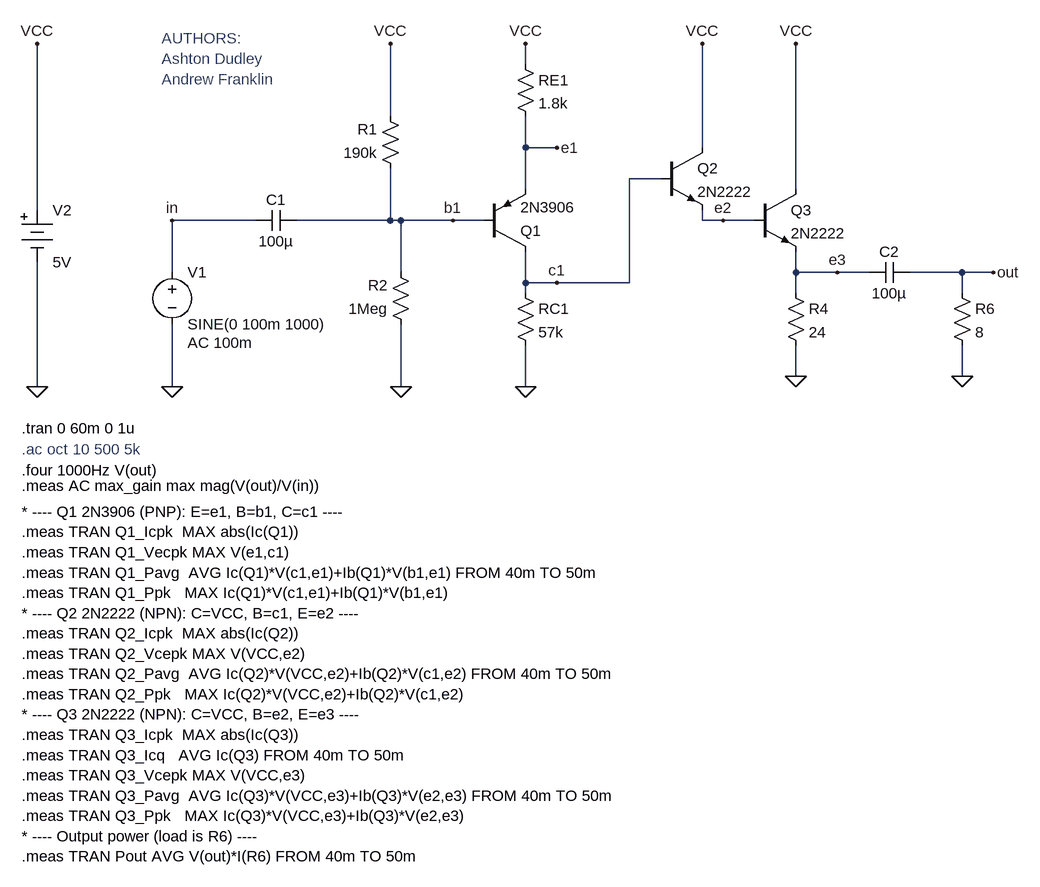
[diagram p0: schematic T5-03 - Lab 5 Amplifer V1.asc]
T5-03 - Lab 5 Amplifer V1.asc, the LTspice schematic file:
Version 4
SHEET 1 984 1068
WIRE 208 -112 208 -144
WIRE 0 -32 0 -144
WIRE 208 16 208 -32
WIRE 256 16 208 16
WIRE 480 16 480 -144
WIRE 416 64 368 64
WIRE 208 80 208 16
WIRE 624 80 624 -144
WIRE -544 112 -544 -144
WIRE -208 128 -336 128
WIRE 0 128 0 48
WIRE 0 128 -144 128
WIRE 16 128 0 128
WIRE 96 128 16 128
WIRE 144 128 96 128
WIRE 480 128 480 112
WIRE 512 128 480 128
WIRE 560 128 512 128
WIRE -336 208 -336 128
WIRE 16 208 16 128
WIRE 624 208 624 176
WIRE 688 208 624 208
WIRE 736 208 688 208
WIRE 880 208 800 208
WIRE 928 208 880 208
WIRE 208 224 208 176
WIRE 256 224 208 224
WIRE 368 224 368 64
WIRE 368 224 256 224
WIRE 208 240 208 224
WIRE 624 240 624 208
WIRE 880 240 880 208
WIRE 624 368 624 320
WIRE 880 368 880 320
WIRE -544 384 -544 192
WIRE -336 384 -336 288
WIRE 16 384 16 288
WIRE 208 384 208 320
FLAG 16 384 0
FLAG -336 128 in
FLAG -336 384 0
FLAG 208 384 0
FLAG -544 384 0
FLAG 256 224 c1
FLAG 256 16 e1
FLAG 96 128 b1
FLAG 0 -144 VCC
FLAG 208 -144 VCC
FLAG -544 -144 VCC
FLAG 480 -144 VCC
FLAG 624 -144 VCC
FLAG 624 368 0
FLAG 880 368 0
FLAG 928 208 out
FLAG 512 128 e2
FLAG 688 208 e3
SYMBOL npn 416 16 R0
SYMATTR InstName Q2
SYMATTR Value 2N2222
SYMBOL res 16 64 R180
WINDOW 0 36 76 Left 2
WINDOW 3 36 40 Left 2
SYMATTR InstName R1
SYMATTR Value 190k
SYMBOL res 32 304 R180
WINDOW 0 36 76 Left 2
WINDOW 3 36 40 Left 2
SYMATTR InstName R2
SYMATTR Value 1Meg
SYMBOL voltage -336 192 R0
WINDOW 123 24 124 Left 2
WINDOW 39 0 0 Left 0
SYMATTR Value2 AC 100m
SYMATTR InstName V1
SYMATTR Value SINE(0 100m 1000)
SYMBOL Misc\\battery -544 96 R0
WINDOW 123 0 0 Left 0
WINDOW 39 0 0 Left 0
SYMATTR InstName V2
SYMATTR Value 5V
SYMBOL cap -144 112 R90
WINDOW 0 0 32 VBottom 2
WINDOW 3 32 32 VTop 2
SYMATTR InstName C1
SYMATTR Value 100µ
SYMBOL res 192 -128 R0
SYMATTR InstName RE1
SYMATTR Value 1.8k
SYMBOL res 192 224 R0
SYMATTR InstName RC1
SYMATTR Value 57k
SYMBOL pnp 144 176 M180
SYMATTR InstName Q1
SYMATTR Value 2N3906
SYMBOL npn 560 80 R0
SYMATTR InstName Q3
SYMATTR Value 2N2222
SYMBOL res 608 224 R0
SYMATTR InstName R4
SYMATTR Value 24
SYMBOL cap 800 192 R90
WINDOW 0 0 32 VBottom 2
WINDOW 3 32 32 VTop 2
SYMATTR InstName C2
SYMATTR Value 100µ
SYMBOL res 864 224 R0
SYMATTR InstName R6
SYMATTR Value 8
TEXT -568 448 Left 2 !.tran 0 60m 0 1u
TEXT -568 480 Left 2 ;.ac oct 10 500 5k
TEXT -568 512 Left 2 !.four 1000Hz V(out)
TEXT -352 -152 Left 2 ;AUTHORS:\nAshton Dudley\nAndrew Franklin
TEXT -568 536 Left 2 !.meas AC max_gain max mag(V(out)/V(in))
TEXT -568 576 Left 2 !* ---- Q1 2N3906 (PNP): E=e1, B=b1, C=c1 ----\n.meas TRAN Q1_Icpk  MAX abs(Ic(Q1))\n.meas TRAN Q1_Vecpk MAX V(e1,c1)\n.meas TRAN Q1_Pavg  AVG Ic(Q1)*V(c1,e1)+Ib(Q1)*V(b1,e1) FROM 40m TO 50m\n.meas TRAN Q1_Ppk   MAX Ic(Q1)*V(c1,e1)+Ib(Q1)*V(b1,e1)\n* ---- Q2 2N2222 (NPN): C=VCC, B=c1, E=e2 ----\n.meas TRAN Q2_Icpk  MAX abs(Ic(Q2))\n.meas TRAN Q2_Vcepk MAX V(VCC,e2)\n.meas TRAN Q2_Pavg  AVG Ic(Q2)*V(VCC,e2)+Ib(Q2)*V(c1,e2) FROM 40m TO 50m\n.meas TRAN Q2_Ppk   MAX Ic(Q2)*V(VCC,e2)+Ib(Q2)*V(c1,e2)\n* ---- Q3 2N2222 (NPN): C=VCC, B=e2, E=e3 ----\n.meas TRAN Q3_Icpk  MAX abs(Ic(Q3))\n.meas TRAN Q3_Icq   AVG Ic(Q3) FROM 40m TO 50m\n.meas TRAN Q3_Vcepk MAX V(VCC,e3)\n.meas TRAN Q3_Pavg  AVG Ic(Q3)*V(VCC,e3)+Ib(Q3)*V(e2,e3) FROM 40m TO 50m\n.meas TRAN Q3_Ppk   MAX Ic(Q3)*V(VCC,e3)+Ib(Q3)*V(e2,e3)\n* ---- Output power (load is R6) ----\n.meas TRAN Pout AVG V(out)*I(R6) FROM 40m TO 50m

The netlist it stands for:
* T5-03 - Lab 5 Amplifer V1.asc
Q2 VCC c1 e2 0 2N2222
R1 b1 VCC 190k
R2 0 b1 1Meg
V1 in 0 SINE(0 100m 1000) AC 100m
V2 VCC 0 5V
C1 b1 in 100µ
RE1 VCC e1 1.8k
RC1 c1 0 57k
Q1 c1 b1 e1 0 2N3906
Q3 VCC e2 e3 0 2N2222
R4 e3 0 24
C2 out e3 100µ
R6 out 0 8
.model NPN NPN
.model PNP PNP
.lib standard.bjt
.tran 0 60m 0 1u
* .ac oct 10 500 5k
.four 1000Hz V(out)
* AUTHORS:
* Ashton Dudley
* Andrew Franklin
.meas AC max_gain max mag(V(out)/V(in))
* ---- Q1 2N3906 (PNP): E=e1, B=b1, C=c1 ----
.meas TRAN Q1_Icpk  MAX abs(Ic(Q1))
.meas TRAN Q1_Vecpk MAX V(e1,c1)
.meas TRAN Q1_Pavg  AVG Ic(Q1)*V(c1,e1)+Ib(Q1)*V(b1,e1) FROM 40m TO 50m
.meas TRAN Q1_Ppk   MAX Ic(Q1)*V(c1,e1)+Ib(Q1)*V(b1,e1)
* ---- Q2 2N2222 (NPN): C=VCC, B=c1, E=e2 ----
.meas TRAN Q2_Icpk  MAX abs(Ic(Q2))
.meas TRAN Q2_Vcepk MAX V(VCC,e2)
.meas TRAN Q2_Pavg  AVG Ic(Q2)*V(VCC,e2)+Ib(Q2)*V(c1,e2) FROM 40m TO 50m
.meas TRAN Q2_Ppk   MAX Ic(Q2)*V(VCC,e2)+Ib(Q2)*V(c1,e2)
* ---- Q3 2N2222 (NPN): C=VCC, B=e2, E=e3 ----
.meas TRAN Q3_Icpk  MAX abs(Ic(Q3))
.meas TRAN Q3_Icq   AVG Ic(Q3) FROM 40m TO 50m
.meas TRAN Q3_Vcepk MAX V(VCC,e3)
.meas TRAN Q3_Pavg  AVG Ic(Q3)*V(VCC,e3)+Ib(Q3)*V(e2,e3) FROM 40m TO 50m
.meas TRAN Q3_Ppk   MAX Ic(Q3)*V(VCC,e3)+Ib(Q3)*V(e2,e3)
* ---- Output power (load is R6) ----
.meas TRAN Pout AVG V(out)*I(R6) FROM 40m TO 50m
.backanno
.end